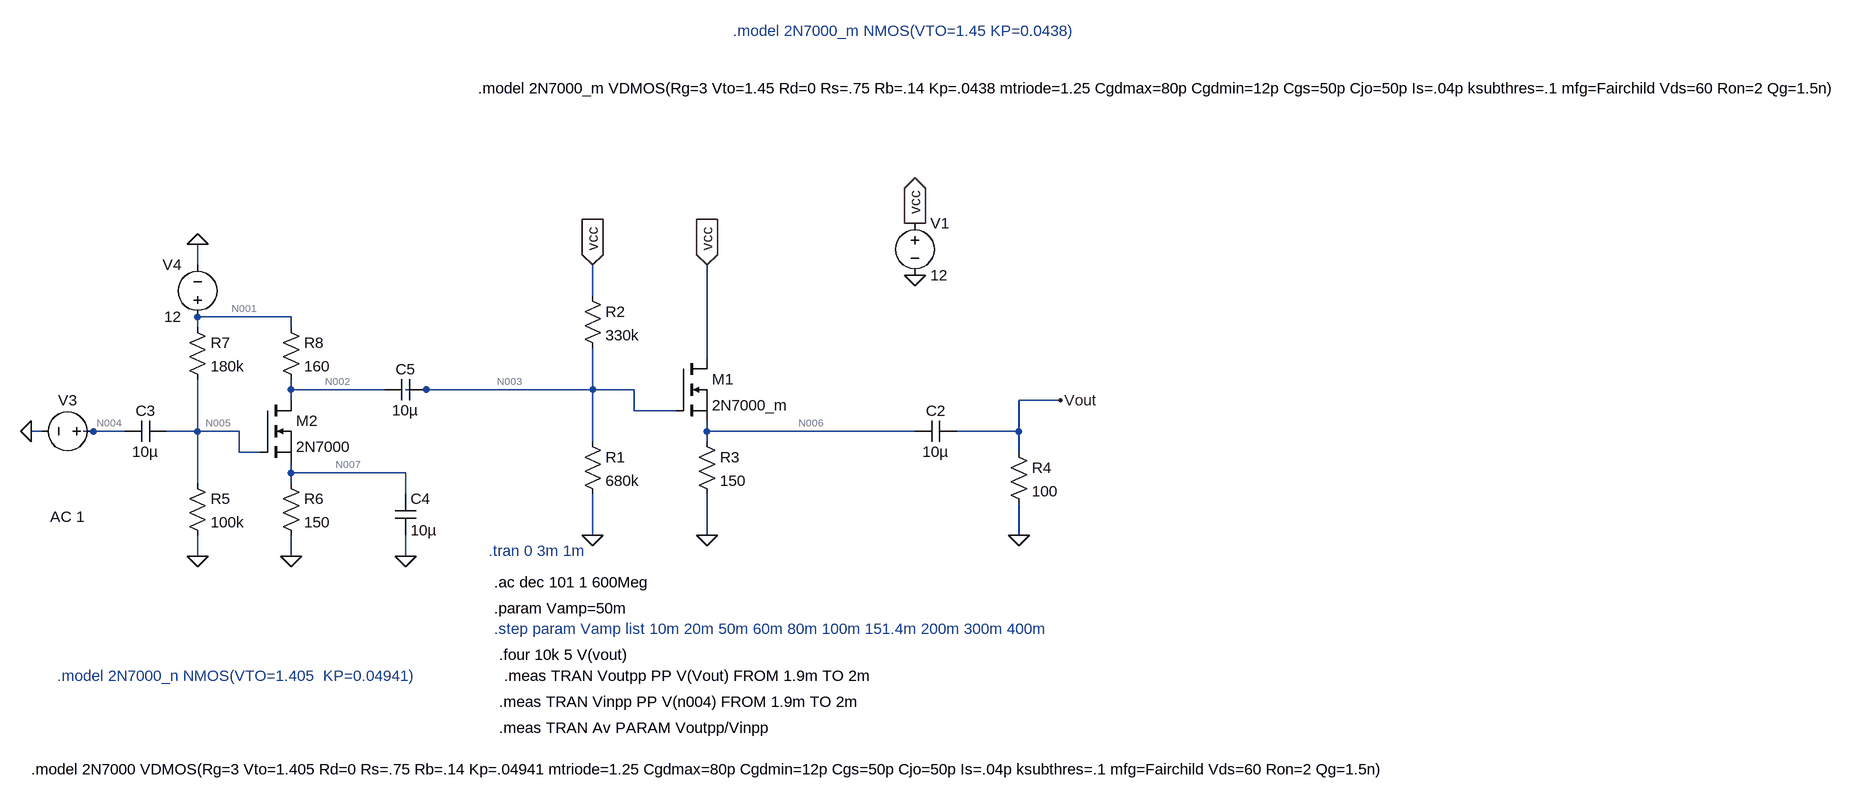
[diagram p0: schematic AmplificadorCascadaFuenteDrainComun.asc]
AmplificadorCascadaFuenteDrainComun.asc, the LTspice schematic file:
Version 4.1
SHEET 1 3060 792
WIRE -736 0 -736 -32
WIRE -128 48 -128 0
WIRE -592 80 -736 80
WIRE -736 96 -736 80
WIRE -592 96 -592 80
WIRE 48 144 48 0
WIRE -592 192 -592 176
WIRE -448 192 -592 192
WIRE -384 192 -416 192
WIRE -128 192 -128 128
WIRE -128 192 -384 192
WIRE -64 192 -128 192
WIRE -592 208 -592 192
WIRE 592 208 528 208
WIRE -64 224 -64 192
WIRE 0 224 -64 224
WIRE -976 256 -992 256
WIRE -896 256 -912 256
WIRE -848 256 -896 256
WIRE -736 256 -736 176
WIRE -736 256 -784 256
WIRE -672 256 -736 256
WIRE 48 256 48 240
WIRE 368 256 48 256
WIRE 528 256 528 208
WIRE 528 256 432 256
WIRE -128 272 -128 192
WIRE 48 272 48 256
WIRE -672 288 -672 256
WIRE -640 288 -672 288
WIRE 528 288 528 256
WIRE -592 320 -592 304
WIRE -416 320 -592 320
WIRE -736 336 -736 256
WIRE -592 336 -592 320
WIRE -416 352 -416 320
WIRE -128 416 -128 352
WIRE 48 416 48 352
WIRE 528 416 528 368
WIRE -736 448 -736 416
WIRE -592 448 -592 416
WIRE -416 448 -416 416
FLAG 368 -64 vcc
IOPIN 368 -64 Out
FLAG 368 16 0
FLAG -128 416 0
FLAG 48 416 0
FLAG 48 0 vcc
IOPIN 48 0 In
FLAG -128 0 vcc
IOPIN -128 0 In
FLAG 528 416 0
FLAG -736 448 0
FLAG -592 448 0
FLAG -416 448 0
FLAG -992 256 0
FLAG -736 -32 0
FLAG 592 208 Vout
SYMBOL voltage 368 -80 R0
WINDOW 123 0 0 Left 0
WINDOW 39 0 0 Left 0
SYMATTR InstName V1
SYMATTR Value 12
SYMBOL res -144 256 R0
SYMATTR InstName R1
SYMATTR Value 680k
SYMBOL res -144 32 R0
SYMATTR InstName R2
SYMATTR Value 330k
SYMBOL res 32 256 R0
SYMATTR InstName R3
SYMATTR Value 150
SYMBOL cap 368 240 M90
WINDOW 0 0 32 VBottom 2
WINDOW 3 32 32 VTop 2
SYMATTR InstName C2
SYMATTR Value 10µ
SYMBOL res 512 272 R0
SYMATTR InstName R4
SYMATTR Value 100
SYMBOL nmos 0 144 R0
SYMATTR InstName M1
SYMATTR Value 2N7000_m
SYMBOL res -752 320 R0
SYMATTR InstName R5
SYMATTR Value 100k
SYMBOL res -608 320 R0
SYMATTR InstName R6
SYMATTR Value 150
SYMBOL res -752 80 R0
SYMATTR InstName R7
SYMATTR Value 180k
SYMBOL res -608 80 R0
SYMATTR InstName R8
SYMATTR Value 160
SYMBOL cap -784 240 R90
WINDOW 0 0 32 VBottom 2
WINDOW 3 32 32 VTop 2
SYMATTR InstName C3
SYMATTR Value 10µ
SYMBOL cap -432 352 R0
SYMATTR InstName C4
SYMATTR Value 10µ
SYMBOL cap -384 176 R90
WINDOW 0 0 32 VBottom 2
WINDOW 3 32 32 VTop 2
SYMATTR InstName C5
SYMATTR Value 10µ
SYMBOL voltage -880 256 R90
WINDOW 0 -32 56 VBottom 2
WINDOW 3 88 56 VTop 2
WINDOW 123 116 56 VTop 2
WINDOW 39 0 0 Left 0
SYMATTR InstName V3
SYMATTR Value ""
SYMATTR Value2 AC 1
SYMBOL voltage -736 96 R180
WINDOW 0 24 96 Left 2
WINDOW 3 24 16 Left 2
WINDOW 123 0 0 Left 0
WINDOW 39 0 0 Left 0
SYMATTR InstName V4
SYMATTR Value 12
SYMBOL nmos -640 208 R0
SYMATTR InstName M2
SYMATTR Value 2N7000
TEXT -288 440 Left 2 ;.tran 0 3m 1m
TEXT 88 -360 Left 2 ;.model 2N7000_m NMOS(VTO=1.45 KP=0.0438)
TEXT -952 632 Left 2 ;.model 2N7000_n NMOS(VTO=1.405  KP=0.04941)
TEXT -280 488 Left 2 !.ac dec 101 1 600Meg
TEXT -280 528 Left 2 !.param Vamp=50m
TEXT -280 560 Left 2 ;.step param Vamp list 10m 20m 50m 60m 80m 100m 151.4m 200m 300m 400m
TEXT -272 600 Left 2 !.four 10k 5 V(vout)
TEXT -264 632 Left 2 !.meas TRAN Voutpp PP V(Vout) FROM 1.9m TO 2m
TEXT -272 672 Left 2 !.meas TRAN Vinpp PP V(n004) FROM 1.9m TO 2m
TEXT -272 712 Left 2 !.meas TRAN Av PARAM Voutpp/Vinpp
TEXT -992 776 Left 2 !.model 2N7000 VDMOS(Rg=3 Vto=1.405 Rd=0 Rs=.75 Rb=.14 Kp=.04941 mtriode=1.25 Cgdmax=80p Cgdmin=12p Cgs=50p Cjo=50p Is=.04p ksubthres=.1 mfg=Fairchild Vds=60 Ron=2 Qg=1.5n)
TEXT -304 -272 Left 2 !.model 2N7000_m VDMOS(Rg=3 Vto=1.45 Rd=0 Rs=.75 Rb=.14 Kp=.0438 mtriode=1.25 Cgdmax=80p Cgdmin=12p Cgs=50p Cjo=50p Is=.04p ksubthres=.1 mfg=Fairchild Vds=60 Ron=2 Qg=1.5n)

The netlist it stands for:
* AmplificadorCascadaFuenteDrainComun.asc
V1 vcc 0 12
R1 N003 0 680k
R2 vcc N003 330k
R3 N006 0 150
C2 N006 Vout 10µ
R4 Vout 0 100
M1 vcc N003 N006 N006 2N7000_m
R5 N005 0 100k
R6 N007 0 150
R7 N001 N005 180k
R8 N001 N002 160
C3 N005 N004 10µ
C4 N007 0 10µ
C5 N003 N002 10µ
V3 N004 0 AC 1
V4 N001 0 12
M2 N002 N005 N007 N007 2N7000
.model NMOS NMOS
.model PMOS PMOS
.lib standard.mos
* .tran 0 3m 1m
* .model 2N7000_m NMOS(VTO=1.45 KP=0.0438)
* .model 2N7000_n NMOS(VTO=1.405  KP=0.04941)
.ac dec 101 1 600Meg
.param Vamp=50m
* .step param Vamp list 10m 20m 50m 60m 80m 100m 151.4m 200m 300m 400m
.four 10k 5 V(vout)
.meas TRAN Voutpp PP V(Vout) FROM 1.9m TO 2m
.meas TRAN Vinpp PP V(n004) FROM 1.9m TO 2m
.meas TRAN Av PARAM Voutpp/Vinpp
.model 2N7000 VDMOS(Rg=3 Vto=1.405 Rd=0 Rs=.75 Rb=.14 Kp=.04941 mtriode=1.25 Cgdmax=80p Cgdmin=12p Cgs=50p Cjo=50p Is=.04p ksubthres=.1 mfg=Fairchild Vds=60 Ron=2 Qg=1.5n)
.model 2N7000_m VDMOS(Rg=3 Vto=1.45 Rd=0 Rs=.75 Rb=.14 Kp=.0438 mtriode=1.25 Cgdmax=80p Cgdmin=12p Cgs=50p Cjo=50p Is=.04p ksubthres=.1 mfg=Fairchild Vds=60 Ron=2 Qg=1.5n)
.backanno
.end

* Results of the author's LTspice run, read from the files saved beside the schematic
* Operating Point, zero values left out:
*   V(n001) = 12 V
*   V(n002) = 9.744 V
*   V(n003) = 8.079 V
*   V(n005) = 4.286 V
*   V(n006) = 5.329 V
*   V(n007) = 2.115 V
*   V(vcc) = 12 V
*   I(R1) = 11.88 µA
*   I(R2) = 11.88 µA
*   I(R3) = 35.53 mA
*   I(R5) = 42.86 µA
*   I(R6) = 14.1 mA
*   I(R7) = 42.86 µA
*   I(R8) = 14.1 mA
*   I(V1) = -35.54 mA
*   I(V4) = -14.14 mA
*   Id(M1) = 35.53 mA
*   Id(M2) = 14.1 mA
*   Ig(M1) = -18.61 pA
*   Ig(M2) = -16.79 pA
*   Is(M1) = -35.53 mA
*   Is(M2) = -14.1 mA
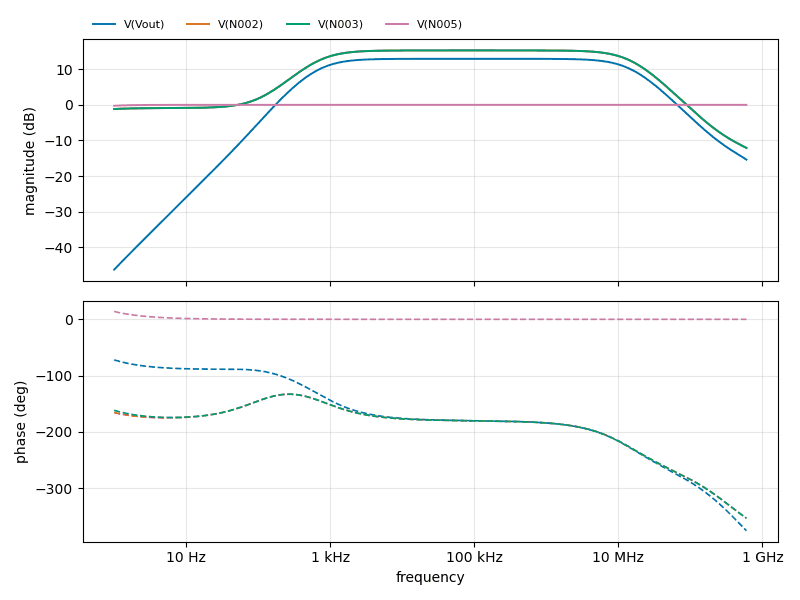
[diagram p1: AC Analysis of AmplificadorCascadaFuenteDrainComun.asc, plotted from the saved traces]
* AC Analysis, 1 run:
*   V(Vout): -46.25 dB at 1 Hz, -15.37 dB at 600 MHz, peak 12.92 dB at 102.3 kHz, 3 dB below the peak at 693.9 Hz and 15.12 MHz
*   V(N002): -1.17 dB at 1 Hz, -12.09 dB at 600 MHz, peak 15.27 dB at 100 kHz, 3 dB below the peak at 667 Hz and 15.14 MHz
*   V(N003): -1.19 dB at 1 Hz, -12.09 dB at 600 MHz, peak 15.27 dB at 100 kHz, 3 dB below the peak at 667 Hz and 15.14 MHz
*   V(N005): -0.26 dB at 1 Hz, -0.00 dB at 600 MHz, peak -0.00 dB at 600 MHz